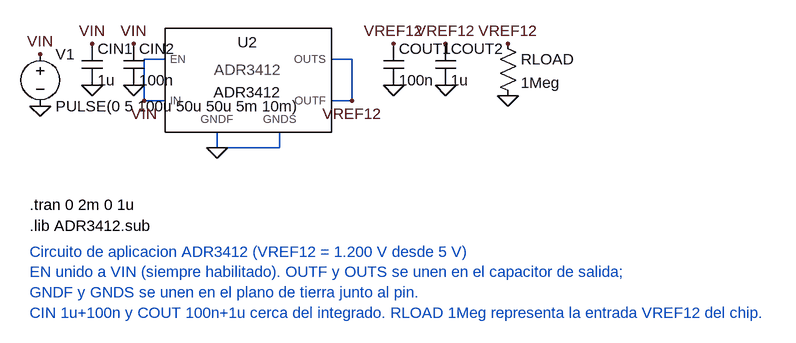
[diagram p0: schematic ADR3412_aplicacion.asc]
ADR3412_aplicacion.asc, the LTspice schematic file:
Version 4
SHEET 1 1200 700
WIRE 272 184 240 184
WIRE 240 184 240 248
WIRE 240 248 272 248
WIRE 528 184 560 184
WIRE 560 184 560 248
WIRE 560 248 528 248
WIRE 352 296 352 320
WIRE 352 320 448 320
WIRE 448 320 448 296
FLAG 80 176 VIN
FLAG 80 256 0
FLAG 160 160 VIN
FLAG 160 224 0
FLAG 224 160 VIN
FLAG 224 224 0
FLAG 240 248 VIN
FLAG 352 320 0
FLAG 560 248 VREF12
FLAG 624 160 VREF12
FLAG 624 224 0
FLAG 704 160 VREF12
FLAG 704 224 0
FLAG 800 160 VREF12
FLAG 800 240 0
SYMBOL voltage 80 160 R0
SYMATTR InstName V1
SYMATTR Value PULSE(0 5 100u 50u 50u 5m 10m)
SYMBOL cap 144 160 R0
SYMATTR InstName CIN1
SYMATTR Value 1u
SYMBOL cap 208 160 R0
SYMATTR InstName CIN2
SYMATTR Value 100n
SYMBOL ADR3412 400 200 R0
SYMATTR InstName U2
SYMBOL cap 608 160 R0
SYMATTR InstName COUT1
SYMATTR Value 100n
SYMBOL cap 688 160 R0
SYMATTR InstName COUT2
SYMATTR Value 1u
SYMBOL res 784 144 R0
SYMATTR InstName RLOAD
SYMATTR Value 1Meg
TEXT 64 408 Left 2 !.tran 0 2m 0 1u
TEXT 64 440 Left 2 !.lib ADR3412.sub
TEXT 64 480 Left 2 ;Circuito de aplicacion ADR3412 (VREF12 = 1.200 V desde 5 V)\nEN unido a VIN (siempre habilitado). OUTF y OUTS se unen en el capacitor de salida;\nGNDF y GNDS se unen en el plano de tierra junto al pin.\nCIN 1u+100n y COUT 100n+1u cerca del integrado. RLOAD 1Meg representa la entrada VREF12 del chip.

The netlist it stands for:
* ADR3412_aplicacion.asc
V1 VIN 0 PULSE(0 5 100u 50u 50u 5m 10m)
CIN1 VIN 0 1u
CIN2 VIN 0 100n
XU2 0 0 VIN VIN VREF12 VREF12 ADR3412  ; pins GNDF GNDS EN IN OUTS OUTF
COUT1 VREF12 0 100n
COUT2 VREF12 0 1u
RLOAD VREF12 0 1Meg
.tran 0 2m 0 1u
.lib ADR3412.sub
* Circuito de aplicacion ADR3412 (VREF12 = 1.200 V desde 5 V)
* EN unido a VIN (siempre habilitado). OUTF y OUTS se unen en el capacitor de salida;
* GNDF y GNDS se unen en el plano de tierra junto al pin.
* CIN 1u+100n y COUT 100n+1u cerca del integrado. RLOAD 1Meg representa la entrada VREF12 del chip.
.lib ADR3412.sub
.backanno
.end